# Altium schematic sheet 03_test2.SchDoc
size A3
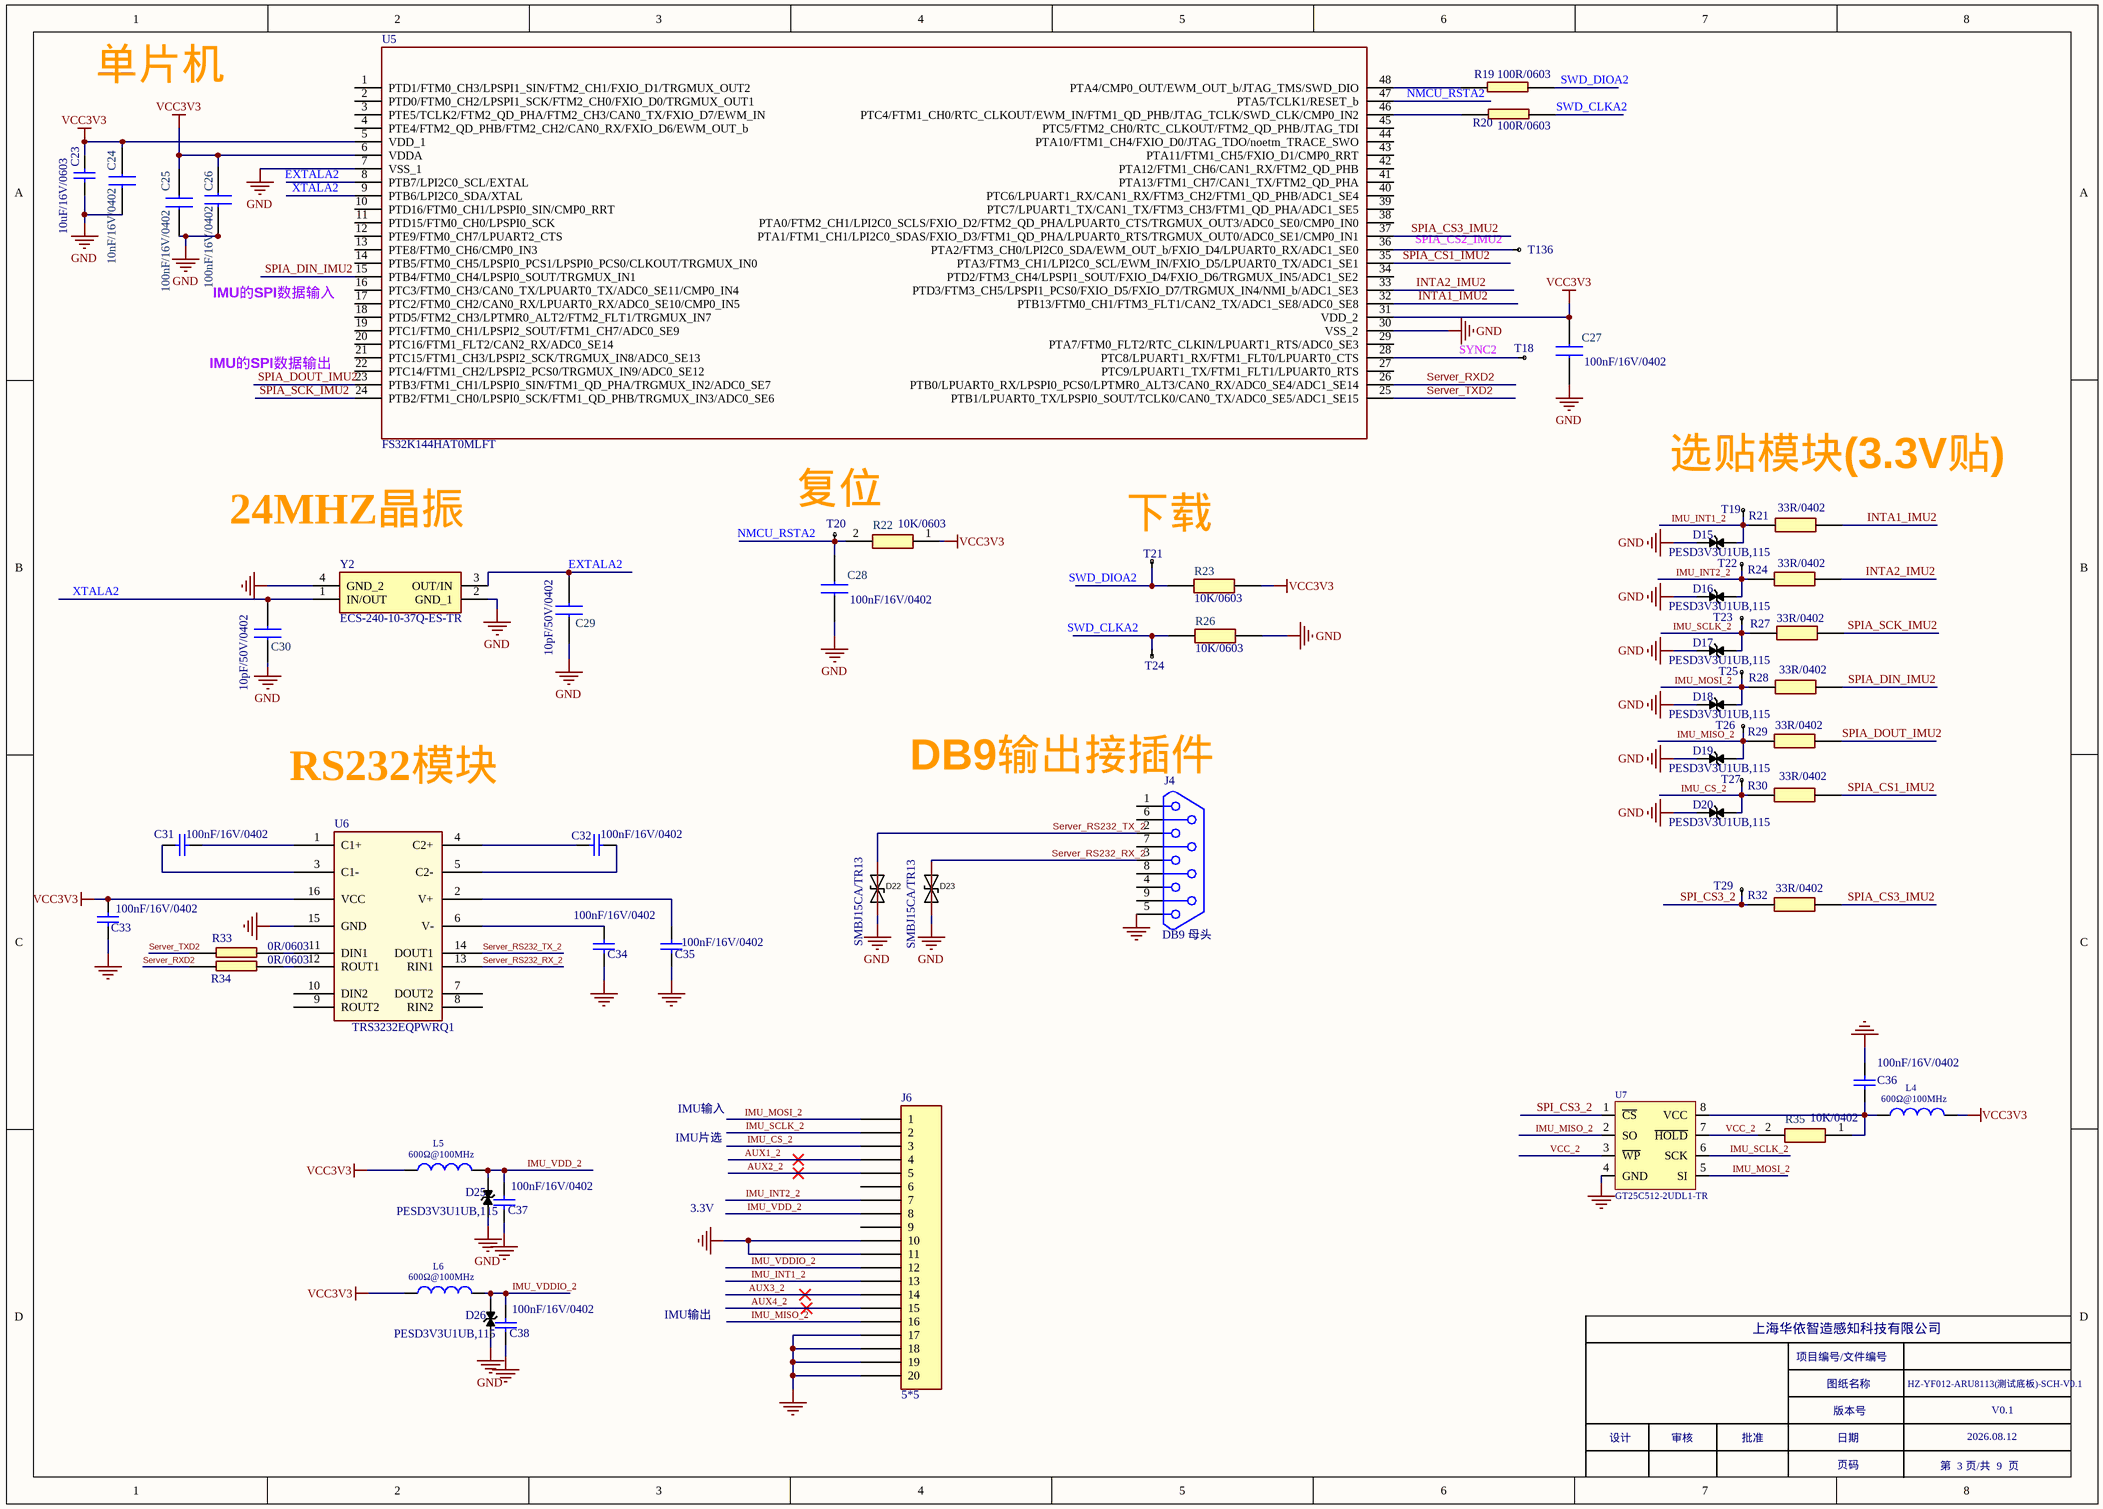
[diagram p0: 03_test2.SchDoc]

## Parts
C23  10uF/16V/0603  [C 0603_L]
C24  10nF/16V/0402  [C 0402_L]
C25  100nF/16V/0402  [C 0402_L]
C26  100nF/16V/0402  [C 0402_L]
C27  100nF/16V/0402  [C 0402_L]
C28  100nF/16V/0402  [C 0402_L]
C29  10pF/50V/0402  [C 0402_L]
C30  10pF/50V/0402  [C 0402_L]
C31  100nF/16V/0402  [C 0402_L]
C32  100nF/16V/0402  [C 0402_L]
C33  100nF/16V/0402  [C 0402_L]
C34  100nF/16V/0402  [C 0402_L]
C35  100nF/16V/0402  [C 0402_L]
C36  100nF/16V/0402  [0402C]
C37  100nF/16V/0402  [0402C]
C38  100nF/16V/0402  [C 0402_L]
D15  PESD3V3U1UB,115  [SOD-523]
D16  PESD3V3U1UB,115  [SOD-523]
D17  PESD3V3U1UB,115  [SOD-523]
D18  PESD3V3U1UB,115  [SOD-523]
D19  PESD3V3U1UB,115  [SOD-523]
D20  PESD3V3U1UB,115  [SOD-523]
D22  SMBJ15CA/TR13  [SMB]
D23  SMBJ15CA/TR13  [SMB]
D25  PESD3V3U1UB,115  [PESD3V3U1UB,115]
D26  PESD3V3U1UB,115  [PESD3V3U1UB,115]
J4  DB9 母头  [DB9-RS8R1-2R77]
J6  5*5  [5*5-socket]
L4  value 600Ω@100MHz  [0603L]  (hidden comment: Inductor)
L5  value 600Ω@100MHz  [0603L]  (hidden comment: Inductor)
L6  value 600Ω@100MHz  [0603L]  (hidden comment: Inductor)
R19  100R/0603  [R 0603_L]
R20  100R/0603  [R 0603_L]
R21  33R/0402  [0402R]
R22  10K/0603  [R 0603_L]
R23  10K/0603  [R 0603_L]
R24  33R/0402  [0402R]
R26  10K/0603  [0603R]
R27  33R/0402  [0402R]
R28  33R/0402  [0402R]
R29  33R/0402  [0402R]
R30  33R/0402  [0402R]
R32  33R/0402  [0402R]
R33  0R/0603  [R 0603_L]
R34  0R/0603  [R 0603_L]
R35  10K/0402  [0402R]
T18  TEST  [Test-0.5mm]  (value not drawn)
T19  TEST  [TEST]  (value not drawn)
T20  TEST  [TEST]  (value not drawn)
T21  TEST  [TEST]  (value not drawn)
T22  TEST  [TEST]  (value not drawn)
T23  TEST  [TEST]  (value not drawn)
T24  TEST  [TEST]  (value not drawn)
T25  TEST  [TEST]  (value not drawn)
T26  TEST  [TEST]  (value not drawn)
T27  TEST  [TEST]  (value not drawn)
T29  TEST  [Test-0.5mm]  (value not drawn)
T136  TEST  [Test-0.5mm]  (value not drawn)
U5  FS32K144HAT0MLFT  [LQFP48_7X7]
U6  TRS3232EQPWRQ1  [TSSOP16_640X500]
U7  GT25C512-2UDL1-TR  [GT25C512-2UDLA2-TR]
Y2  ECS-240-10-37Q-ES-TR  [ECS2401037QESTR]

## Nets
GND: C23.2 C24.1 C25.2 C26.2 C27.2 C28.2 C29.1 C30.1 C33.2 C34.2 C35.2 C36.1 C37.2 C38.2 D15.1 D16.1 D17.1 D18.1 D19.1 D20.1 D22.1 D23.1 D25.1 D26.1 J4.5 J6.10 J6.11 J6.17 J6.18 J6.19 J6.20 R26.1 U5.7(VSS_1) U5.30(VSS_2) U6.15(GND) U7.4(GND) Y2.2(GND_1) Y2.4(GND_2)
VCC3V3: C23.1 C24.2 C25.1 C26.1 C27.1 C33.1 L4.2 L5.1 L6.1 R22.1 R23.1 U5.5(VDD_1) U5.6(VDDA) U5.31(VDD_2) U6.16(VCC)
AUX1_2: J6.4
AUX2_2: J6.5
AUX3_2: J6.14
AUX4_2: J6.15
EXTALA2: C29.2 U5.8(PTB7/LPI2C0_SCL/EXTAL) Y2.3(OUT/IN)
IMU_CS_2: D20.2 J6.3 R30.2 T27.1
IMU_INT1_2: D15.2 J6.13 R21.2 T19.1
IMU_INT2_2: D16.2 J6.7 R24.2 T22.1
IMU_MISO_2: D19.2 J6.16 R29.2 T26.1 U7.2(SO)
IMU_MOSI_2: D18.2 J6.1 R28.2 T25.1 U7.5(SI)
IMU_SCLK_2: D17.2 J6.2 R27.2 T23.1 U7.6(SCK)
IMU_VDD_2: C37.1 D25.2 J6.8 L5.2
IMU_VDDIO_2: C38.1 D26.2 J6.12 L6.2
INTA1_IMU2: R21.1 U5.32(PTB13/FTM0_CH1/FTM3_FLT1/CAN2_TX/ADC1_SE8/ADC0_SE8)
INTA2_IMU2: R24.1 U5.33(PTD3/FTM3_CH5/LPSPI1_PCS0/FXIO_D5/FXIO_D7/TRGMUX_IN4/NMI_b/ADC1_SE3)
NMCU_RSTA2: C28.1 R22.2 T20.1 U5.47(PTA5/TCLK1/RESET_b)
Server_RS232_RX_2: D23.2 J4.3 U6.13(RIN1)
Server_RS232_TX_2: D22.2 J4.2 U6.14(DOUT1)
Server_RXD2: R34.1 U5.26(PTB0/LPUART0_RX/LPSPI0_PCS0/LPTMR0_ALT3/CAN0_RX/ADC0_SE4/ADC1_SE14)
Server_TXD2: R33.1 U5.25(PTB1/LPUART0_TX/LPSPI0_SOUT/TCLK0/CAN0_TX/ADC0_SE5/ADC1_SE15)
SPI_CS3_2: R32.2 T29.1 U7.1(~{CS})
SPIA_CS1_IMU2: R30.1 U5.35(PTA3/FTM3_CH1/LPI2C0_SCL/EWM_IN/FXIO_D5/LPUART0_TX/ADC1_SE1)
SPIA_CS3_IMU2: R32.1 U5.37(PTA1/FTM1_CH1/LPI2C0_SDAS/FXIO_D3/FTM1_QD_PHA/LPUART0_RTS/TRGMUX_OUT0/ADC0_SE1/CMP0_IN1)
SPIA_DIN_IMU2: R28.1 U5.15(PTB4/FTM0_CH4/LPSPI0_SOUT/TRGMUX_IN1)
SPIA_DOUT_IMU2: R29.1 U5.23(PTB3/FTM1_CH1/LPSPI0_SIN/FTM1_QD_PHA/TRGMUX_IN2/ADC0_SE7)
SPIA_SCK_IMU2: R27.1 U5.24(PTB2/FTM1_CH0/LPSPI0_SCK/FTM1_QD_PHB/TRGMUX_IN3/ADC0_SE6)
SWD_CLKA2: R20.2 R26.2 T24.1
SWD_DIOA2: R19.2 R23.2 T21.1
SYNC2: T18.1 U5.28(PTC8/LPUART1_RX/FTM1_FLT0/LPUART0_CTS)
VCC_2: R35.2 U7.3(~{WP}) U7.7(~{HOLD})
XTALA2: C30.2 U5.9(PTB6/LPI2C0_SDA/XTAL) Y2.1(IN/OUT)
NetC31_1: C31.1 U6.3(C1-)
NetC31_2: C31.2 U6.1(C1+)
NetC32_1: C32.1 U6.4(C2+)
NetC32_2: C32.2 U6.5(C2-)
NetC34_1: C34.1 U6.6(V-)
NetC35_1: C35.1 U6.2(V+)
NetC36_2: C36.2 L4.1 R35.1 U7.8(VCC)
NetR19_1: R19.1 U5.48(PTA4/CMP0_OUT/EWM_OUT_b/JTAG_TMS/SWD_DIO)
NetR20_1: R20.1 U5.46(PTC4/FTM1_CH0/RTC_CLKOUT/EWM_IN/FTM1_QD_PHB/JTAG_TCLK/SWD_CLK/CMP0_IN2)
NetR33_2: R33.2 U6.11(DIN1)
NetR34_2: R34.2 U6.12(ROUT1)
NetT136_1: T136.1 U5.36(PTA2/FTM3_CH0/LPI2C0_SDA/EWM_OUT_b/FXIO_D4/LPUART0_RX/ADC1_SE0)

Not connected (* = marked no-connect by the designer): J4 1 4 6 7 8 9; J6 6 9; U5 1(PTD1/FTM0_CH3/LPSPI1_SIN/FTM2_CH1/FXIO_D1/TRGMUX_OUT2) 2(PTD0/FTM0_CH2/LPSPI1_SCK/FTM2_CH0/FXIO_D0/TRGMUX_OUT1) 3(PTE5/TCLK2/FTM2_QD_PHA/FTM2_CH3/CAN0_TX/FXIO_D7/EWM_IN) 4(PTE4/FTM2_QD_PHB/FTM2_CH2/CAN0_RX/FXIO_D6/EWM_OUT_b) 10(PTD16/FTM0_CH1/LPSPI0_SIN/CMP0_RRT) 11(PTD15/FTM0_CH0/LPSPI0_SCK) 12(PTE9/FTM0_CH7/LPUART2_CTS) 13(PTE8/FTM0_CH6/CMP0_IN3) 14(PTB5/FTM0_CH5/LPSPI0_PCS1/LPSPI0_PCS0/CLKOUT/TRGMUX_IN0) 16(PTC3/FTM0_CH3/CAN0_TX/LPUART0_TX/ADC0_SE11/CMP0_IN4) 17(PTC2/FTM0_CH2/CAN0_RX/LPUART0_RX/ADC0_SE10/CMP0_IN5) 18(PTD5/FTM2_CH3/LPTMR0_ALT2/FTM2_FLT1/TRGMUX_IN7) 19(PTC1/FTM0_CH1/LPSPI2_SOUT/FTM1_CH7/ADC0_SE9) 20(PTC16/FTM1_FLT2/CAN2_RX/ADC0_SE14) 21(PTC15/FTM1_CH3/LPSPI2_SCK/TRGMUX_IN8/ADC0_SE13) 22(PTC14/FTM1_CH2/LPSPI2_PCS0/TRGMUX_IN9/ADC0_SE12) 27(PTC9/LPUART1_TX/FTM1_FLT1/LPUART0_RTS) 29(PTA7/FTM0_FLT2/RTC_CLKIN/LPUART1_RTS/ADC0_SE3) 34(PTD2/FTM3_CH4/LPSPI1_SOUT/FXIO_D4/FXIO_D6/TRGMUX_IN5/ADC1_SE2) 38(PTA0/FTM2_CH1/LPI2C0_SCLS/FXIO_D2/FTM2_QD_PHA/LPUART0_CTS/TRGMUX_OUT3/ADC0_SE0/CMP0_IN0) 39(PTC7/LPUART1_TX/CAN1_TX/FTM3_CH3/FTM1_QD_PHA/ADC1_SE5) 40(PTC6/LPUART1_RX/CAN1_RX/FTM3_CH2/FTM1_QD_PHB/ADC1_SE4) 41(PTA13/FTM1_CH7/CAN1_TX/FTM2_QD_PHA) 42(PTA12/FTM1_CH6/CAN1_RX/FTM2_QD_PHB) 43(PTA11/FTM1_CH5/FXIO_D1/CMP0_RRT) 44(PTA10/FTM1_CH4/FXIO_D0/JTAG_TDO/noetm_TRACE_SWO) 45(PTC5/FTM2_CH0/RTC_CLKOUT/FTM2_QD_PHB/JTAG_TDI); U6 7(DOUT2) 8(RIN2) 9(ROUT2) 10(DIN2)

## Notes on the sheet
- 单片机
- IMU的SPI数据输入
- IMU的SPI数据输出
- (near T20) 复位
- 选贴模块(3.3V贴)
- (near Y2) 24MHZ晶振
- (near T21) 下载
- (near U6) RS232模块
- DB9输出接插件
- IMU输入
- IMU片选
- 3.3V
- IMU输出
- 上海华依智造感知科技有限公司
- 项目编号/文件编号
- 图纸名称
- HZ-YF012-ARU8113(测试底板)-SCH-V0.1
- 设计
- 审核
- 批准
- 版本号
- 日期
- 2026.08.12
- V0.1
- 页码
- 第  3 页/共  9  页
- Labels drawn without touching a wire or pin: SPIA_CS2_IMU2

## Library data of the parts
C23 = Cap: SMD/SMT 10UF 16V 20% 0603; Published: 8-Jun-2000; LatestRevisionDate: 17-Jul-2002; LatestRevisionNote: Re-released for DXP Platform.; PackageReference: RAD-0.3; Publisher: Altium Limited; PackageDescription: Radial Cap, Thru-Hole; 2 Leads; 0.3 in Pin Spacing; Value: 10uF/16V
C24-C30 = 0402Capacitor: Capacitor; Manufacturer_Name: Murata Electronics; Manufacturer_Part_Number: GCM155R71C104KA55D; Datasheet Link: https://componentsearchengine.com//GCM155R71C104KA55D.pdf; Height: 0.55mm; Mouser2 Part Number: 81-GCM155R71C104KA5D; Mouser2 Price/Stock: https://www.mouser.com/Search/Refine.aspx?Keyword=81-GCM155R71C104KA5D
C31-C35 = Cap: '100nF/16V/10%/ 0402/X7R / -55℃ ～ 125℃/AEC-Q200; Value: 100nF/16V/0603; Published: 8-Jun-2000; LatestRevisionDate: 17-Jul-2002; LatestRevisionNote: Re-released for DXP Platform.; PackageReference: RAD-0.3; Publisher: Altium Limited; PackageDescription: Radial Cap, Thru-Hole; 2 Leads; 0.3 in Pin Spacing
C36-C38 = Cap: '100nF/16V/10%/ 0402/X7R / -55℃ ～ 125℃/AEC-Q200; Published: 8-Jun-2000; LatestRevisionDate: 17-Jul-2002; LatestRevisionNote: Re-released for DXP Platform.; PackageReference: RAD-0.3; Publisher: Altium Limited; PackageDescription: Radial Cap, Thru-Hole; 2 Leads; 0.3 in Pin Spacing; Value: 100nF/16V/0402
D15-D20 D25 D26 = SMBJ36CA: 双向TVS管；600W表面贴装瞬态电压抑制器,工作电压36V，SMB_DO-214AA封装 DIODES
D22 D23 = SMBJ15CA/TR13_C78410: Manufacturer: Brightking(君耀电子); Symbol: SMBJ15CA-C78410; Add into BOM: yes; polarity: 双向; Reverse Stand-Off Voltage (Vrwm): 15V; Maximum Clamping Voltage: 24.4V; Peak Pulse Current (Ipp)@10/1000us: 24.6A; Peak Pulse Power Dissipation (Ppp)@10/1000us: 600W; Breakdown Voltage: 16.7V; Type: TVS; Device: SMBJ15CA/TR13_C78410; LCSC Part Name: 双向 15V截止 24.6A峰值脉冲; Supplier Part: C78410; Manufacturer Part: SMBJ15CA/TR13; Supplier Footprint: SMB(DO-214AA); JLCPCB Part Class: Extended Part; Datasheet: https://atta.szlcsc.com/upload/public/pdf/source/20181127/C309995_EB3DFB9F9AEE5D2146ECD9FA5992A402.pdf; Supplier: LCSC; Convert to PCB: yes
J4 = DB9
L4-L6 = Inductor: Code_IEC: 1005; Published: 8-Jun-2000; LatestRevisionDate: 29-May-2009; LatestRevisionNote: IPC-7351 Footprint Added.; PackageReference: 0402-A; Publisher: Altium Limited; PackageDescription: Chip Inductor; Code_JEITA: 0402
R19 R20 R33 R34 = 0402
R21-R24 R26-R30 R32 R35 = 0402Resistor: Resistor; Manufacturer_Name: KOA Speer; Manufacturer_Part_Number: RN73H1ETTP1002F50; Datasheet Link: https://www.mouser.fr/datasheet/2/219/RN73H-12200.pdf; Height: 0.4mm
U5 = FS32K144HAT0MLFT: Integrated Circuit; Manufacturer_Name: NXP; Datasheet Link: http://www.nxp.com/docs/en/data-sheet/S32K-DS.pdf; Height: 1.6mm; Manufacturer_Part_Number: FS32K144HAT0MLFT
U7 = GT25C512-2UDLA2-TR
Y2 = ECS-240-10-37Q-ES-TR: Crystal or Oscillator; Manufacturer_Name: ECS; Datasheet Link: https://www.ecsxtal.com/store/pdf/ECX-1637Q.pdf; Height: 0.55mm; Manufacturer_Part_Number: ECS-240-10-37Q-ES-TR